# EasyEDA Pro project fei1554973967-sw3538-dff8db20.epro, board PCB7_1
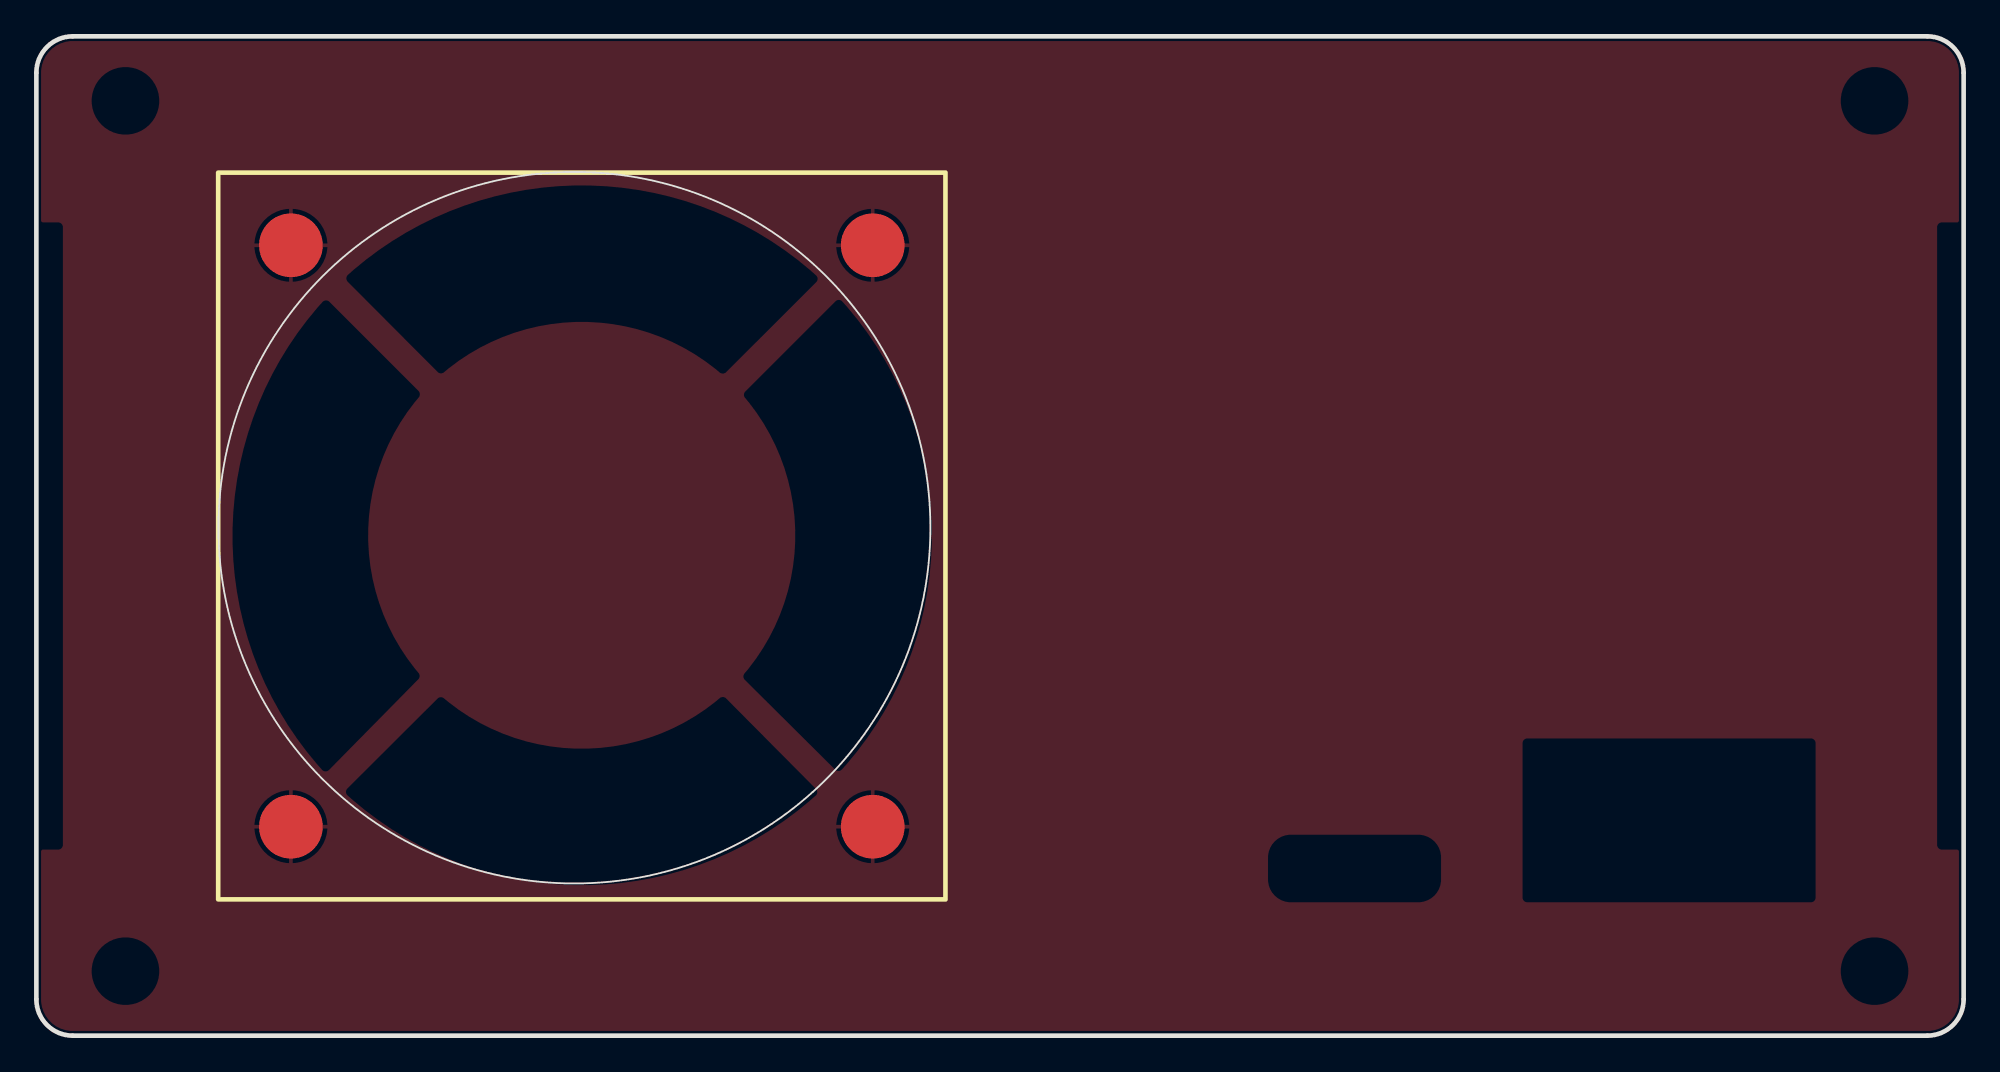
[diagram p9: board, top side]
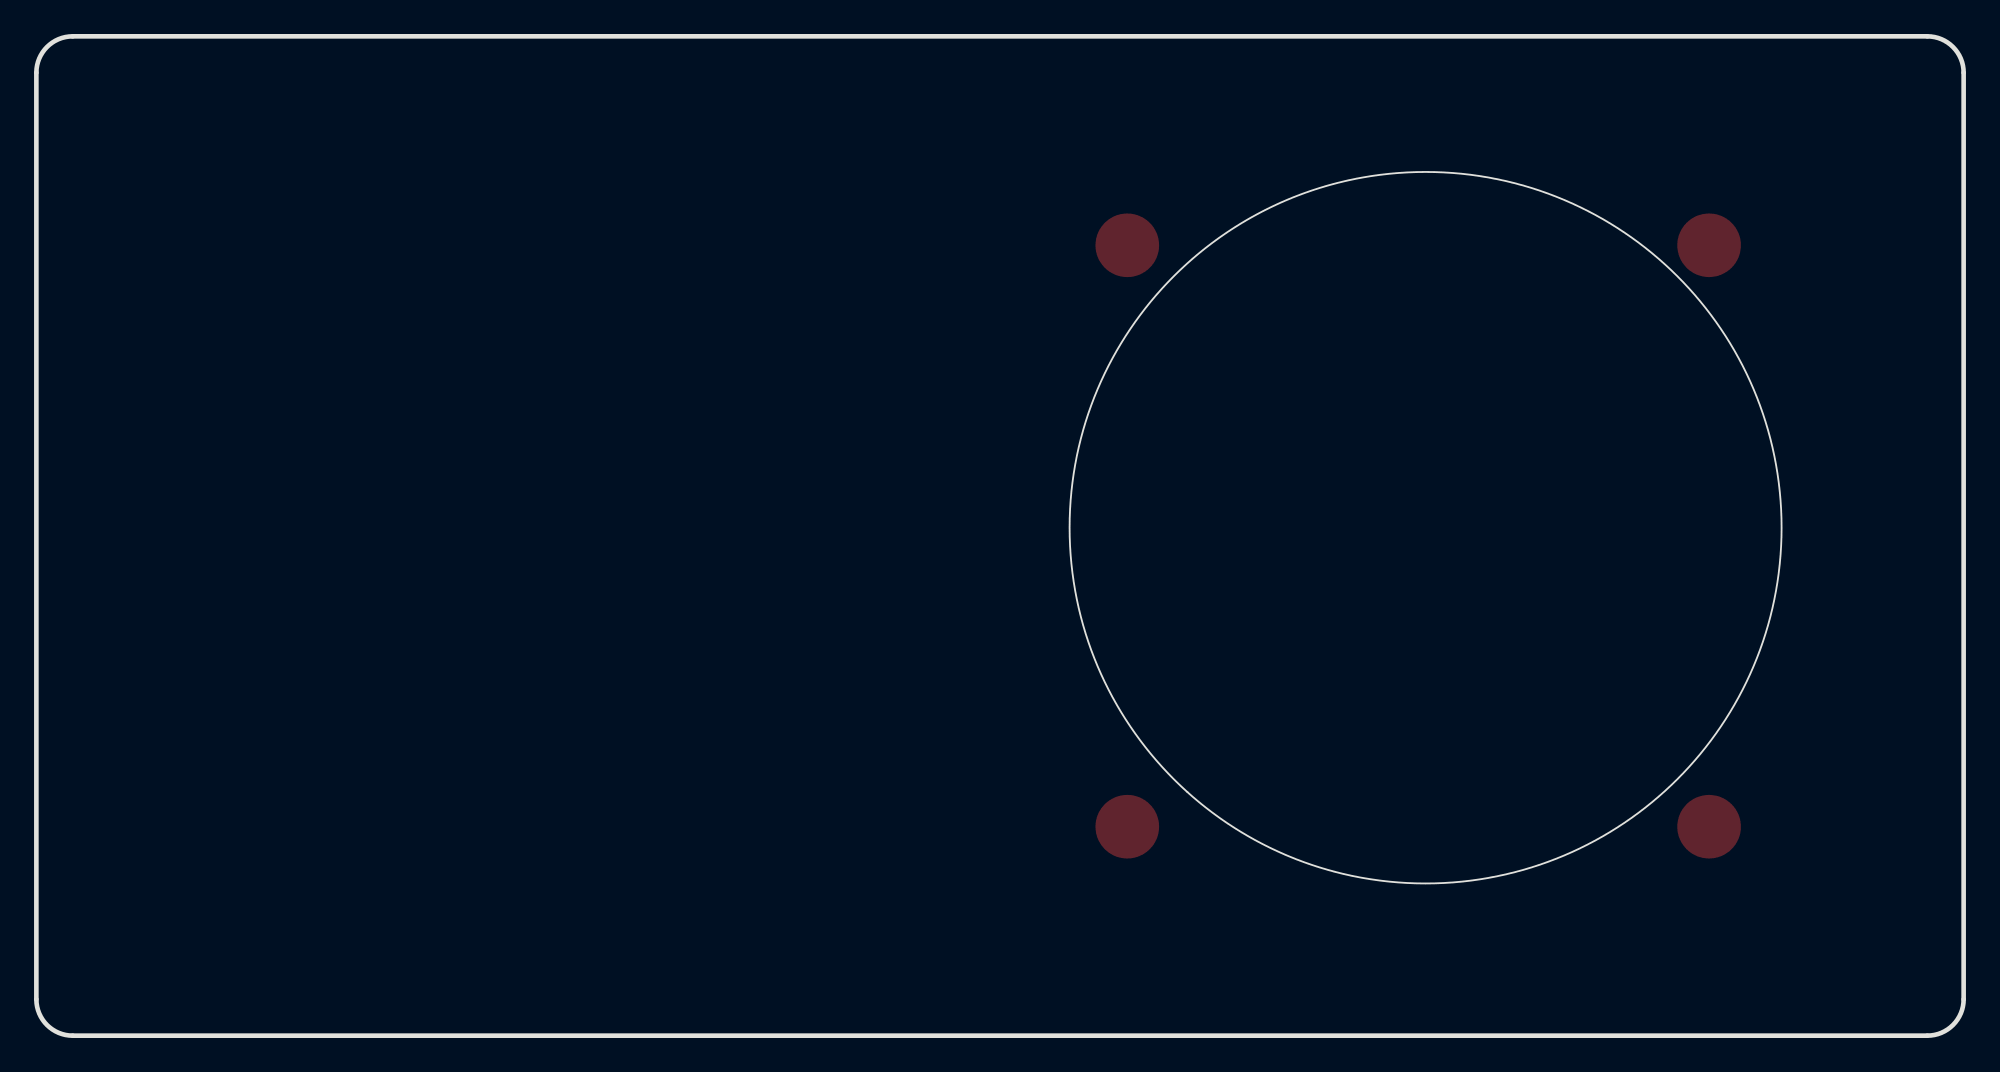
[diagram p10: board, bottom side, seen from below]

Outline 106 x 55 mm; copper layers: Top Layer, Bottom Layer. Coordinates in mm from the lower left corner of the outline.
Outline path: 42.69,13.4 42.69,13.4 ; 0,53 0,2 arc(0.59,0.59) 2,0 104,0 arc(105.41,0.59) 106,2 106,53 arc(105.41,54.41) 104,55 2,55 arc(0.59,54.41) 0,53
Stack: Top Layer 0.035mm / Dielectric1 1.51mm FR4 er 4.5 / Bottom Layer 0.035mm

## Design rules (mm)
spacing copperThickness1oz (default): track to track 0.102, other pairs 0.152 to 0.3
spacing copperThickness2oz: track to track 0.203, other pairs 0.152 to 0.3
spacing Plane_innerPlane: track to track 0.102, other pairs 0.152 to 0.3
spacing Copper_copperRegion: track to track 0.102, other pairs 0.152 to 0.3
track width copperThickness1oz (default): min 0.127, default 0.254, max 2.54
track width copperThickness2oz: min 0.203, default 0.254, max 2.54
differential pair differentialPair (default): width min 0.127, default 0.254, max 2.54; gap min 0.152, default 0.152
pour e21 uses Copper_copperRegion

## Placement (name value [footprint] x y rotation side)
NOREF  -  [Pad_e3]  46 43.5 0 top
NOREF#2  -  [Pad_e2]  14 11.5 0 top
NOREF#3  -  [Pad_e4]  14 43.5 0 top
NOREF#4  -  [Pad_e1]  46 11.5 0 top

## Footprints (pads in the part's own frame, mm; a bottom-side part is the same pattern mirrored in y, then rotated)
Pad_e1
  round 3.5 smd: 1(0,0)
Pad_e2
  round 3.5 smd: 1(0,0)
Pad_e3
  round 3.5 smd: 2(0,0)
Pad_e4
  round 3.5 smd: 3(0,0)

## Nets
GND: NOREF.2 NOREF#2.1 NOREF#3.3 NOREF#4.1

## Copper pours and planes (outline as drawn; the poured copper is in the pictures)
GND on Top Layer: -9.31,59.39 115.23,59.39 115.23,-7.1 -9.31,-7.1
